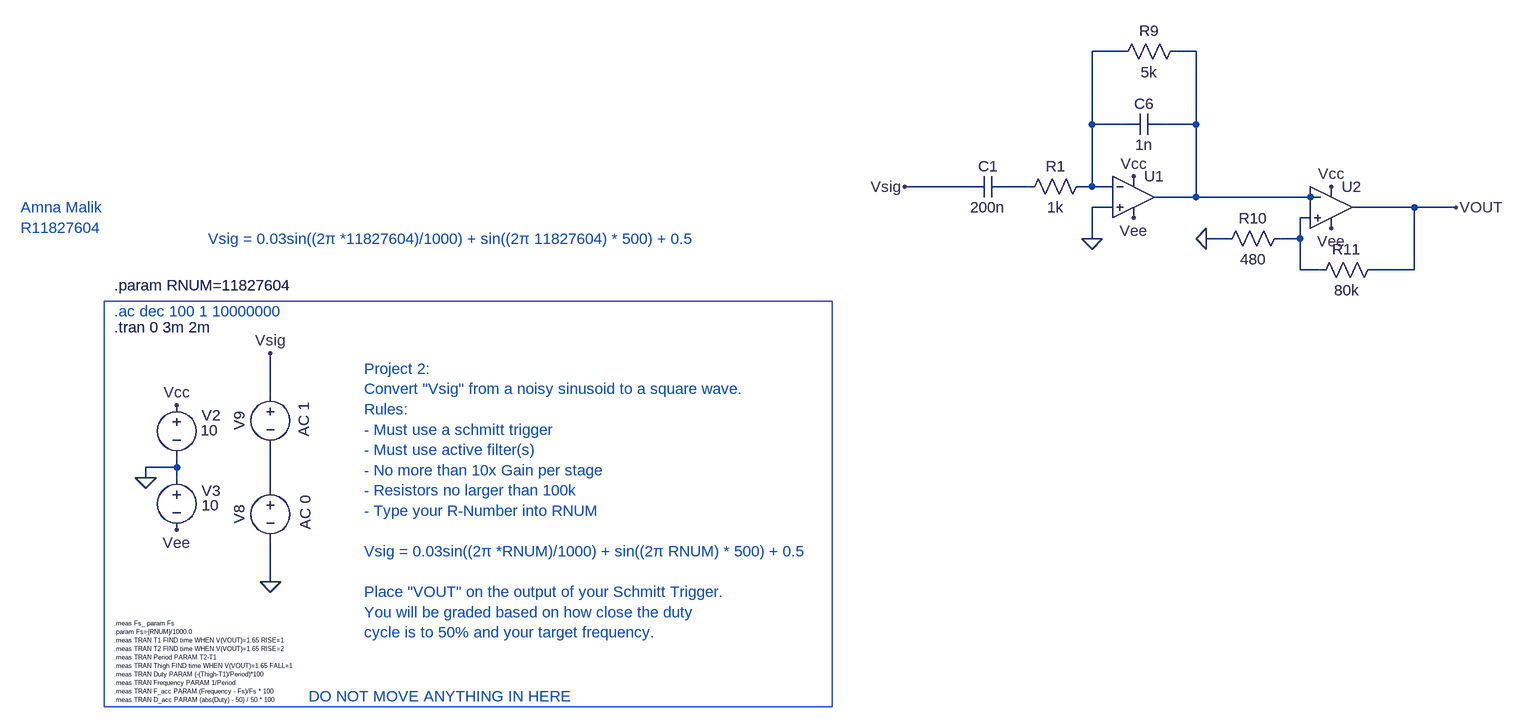
[diagram p0: schematic Project 2.asc]
Project 2.asc, the LTspice schematic file:
Version 4.1
SHEET 1 2724 1272
WIRE 1104 -432 1056 -432
WIRE 1216 -432 1184 -432
WIRE 1056 -320 1056 -432
WIRE 1104 -320 1056 -320
WIRE 1216 -320 1216 -432
WIRE 1216 -320 1168 -320
WIRE 864 -224 768 -224
WIRE 960 -224 928 -224
WIRE 1056 -224 1056 -320
WIRE 1056 -224 1040 -224
WIRE 1088 -224 1056 -224
WIRE 1216 -208 1216 -320
WIRE 1216 -208 1152 -208
WIRE 1392 -208 1216 -208
WIRE 1408 -208 1392 -208
WIRE 1088 -192 1056 -192
WIRE 1552 -192 1456 -192
WIRE 1616 -192 1552 -192
WIRE 1392 -176 1376 -176
WIRE 1056 -144 1056 -192
WIRE 1264 -144 1232 -144
WIRE 1376 -144 1376 -176
WIRE 1376 -144 1344 -144
WIRE 1376 -96 1376 -144
WIRE 1408 -96 1376 -96
WIRE 1552 -96 1552 -192
WIRE 1552 -96 1488 -96
WIRE -208 96 -208 32
WIRE -352 208 -352 192
WIRE -352 208 -400 208
WIRE -400 224 -400 208
WIRE -352 224 -352 208
WIRE -208 240 -208 176
WIRE -208 384 -208 320
FLAG -400 224 0
FLAG -352 112 Vcc
FLAG -352 304 Vee
FLAG 1616 -192 VOUT
FLAG -208 384 0
FLAG -208 32 Vsig
FLAG 1056 -144 0
FLAG 1232 -144 0
FLAG 768 -224 Vsig
FLAG 1120 -240 Vcc
FLAG 1424 -224 Vcc
FLAG 1120 -176 Vee
FLAG 1424 -160 Vee
SYMBOL voltage -352 96 R0
WINDOW 3 37 55 Left 2
WINDOW 123 0 0 Left 0
WINDOW 39 0 0 Left 0
WINDOW 0 38 32 Left 2
SYMATTR Value 10
SYMATTR InstName V2
SYMBOL voltage -352 208 R0
WINDOW 3 38 58 Left 2
WINDOW 123 0 0 Left 0
WINDOW 39 0 0 Left 0
WINDOW 0 38 36 Left 2
SYMATTR Value 10
SYMATTR InstName V3
SYMBOL voltage -208 224 R0
WINDOW 0 -32 56 VBottom 2
WINDOW 3 1 79 Invisible 2
WINDOW 123 38 53 VTop 2
WINDOW 39 0 0 Left 0
SYMATTR InstName V8
SYMATTR Value SINE(0 0.03 {Fs})
SYMATTR Value2 AC 0
SYMBOL voltage -208 80 R0
WINDOW 0 -32 56 VBottom 2
WINDOW 3 0 81 Invisible 2
WINDOW 123 36 54 VTop 2
WINDOW 39 0 0 Left 0
SYMATTR InstName V9
SYMATTR Value SINE(0.5 1 {Fs*500})
SYMATTR Value2 AC 1
SYMBOL res 1200 -448 R90
WINDOW 0 0 56 VBottom 2
WINDOW 3 32 56 VTop 2
SYMATTR InstName R9
SYMATTR Value 5k
SYMBOL cap 1168 -336 R90
WINDOW 0 0 32 VBottom 2
WINDOW 3 32 32 VTop 2
SYMATTR InstName C6
SYMATTR Value 1n
SYMBOL res 1360 -160 R90
WINDOW 0 0 56 VBottom 2
WINDOW 3 32 56 VTop 2
SYMATTR InstName R10
SYMATTR Value 480
SYMBOL res 1504 -112 R90
WINDOW 0 0 56 VBottom 2
WINDOW 3 32 56 VTop 2
SYMATTR InstName R11
SYMATTR Value 80k
SYMBOL cap 928 -240 R90
WINDOW 0 0 32 VBottom 2
WINDOW 3 32 32 VTop 2
SYMATTR InstName C1
SYMATTR Value 200n
SYMBOL res 1056 -240 R90
WINDOW 0 0 56 VBottom 2
WINDOW 3 32 56 VTop 2
SYMATTR InstName R1
SYMATTR Value 1k
SYMBOL OpAmps\\UniversalOpAmp2 1120 -208 R0
SYMATTR InstName U1
SYMBOL OpAmps\\UniversalOpAmp2 1424 -192 R0
SYMATTR InstName U2
TEXT -448 -32 Left 2 ;.ac dec 100 1 10000000
TEXT -448 -8 Left 2 !.tran 0 3m 2m
TEXT -448 -72 Left 2 !.param RNUM=11827604
TEXT -448 448 Left 0 !.meas Fs_ param Fs\n.param Fs={RNUM}/1000.0\n.meas TRAN T1 FIND time WHEN V(VOUT)=1.65 RISE=1\n.meas TRAN T2 FIND time WHEN V(VOUT)=1.65 RISE=2\n.meas TRAN Period PARAM T2-T1\n.meas TRAN Thigh FIND time WHEN V(VOUT)=1.65 FALL=1                  \n.meas TRAN Duty PARAM (-(Thigh-T1)/Period)*100\n.meas TRAN Frequency PARAM 1/Period\n.meas TRAN F_acc PARAM (Frequency - Fs)/Fs * 100\n.meas TRAN D_acc PARAM (abs(Duty) - 50) / 50 * 100
TEXT 256 560 Right 2 ;DO NOT MOVE ANYTHING IN HERE
TEXT -64 56 Left 2 ;Project 2:\nConvert "Vsig" from a noisy sinusoid to a square wave.\nRules:\n- Must use a schmitt trigger\n- Must use active filter(s)\n- No more than 10x Gain per stage\n- Resistors no larger than 100k\n- Type your R-Number into RNUM\n \nVsig = 0.03sin((2π *RNUM)/1000) + sin((2π RNUM) * 500) + 0.5\n \nPlace "VOUT" on the output of your Schmitt Trigger.\nYou will be graded based on how close the duty\ncycle is to 50% and your target frequency.
TEXT -304 -144 Left 2 ;Vsig = 0.03sin((2π *11827604)/1000) + sin((2π 11827604) * 500) + 0.5
TEXT -592 -192 Left 2 ;Amna Malik\nR11827604
RECTANGLE Normal 656 576 -464 -48

The netlist it stands for:
* Project 2.asc
V2 Vcc 0 10
V3 0 Vee 10
V8 N005 0 SINE(0 0.03 {Fs}) AC 0
V9 Vsig N005 SINE(0.5 1 {Fs*500}) AC 1
R9 N002 N001 5k
C6 N002 N001 1n
R10 N004 0 480
R11 VOUT N004 80k
C1 N003 Vsig 200n
R1 N001 N003 1k
X§U1 0 N001 Vcc Vee N002 level2 Avol=1Meg GBW=10Meg Slew=10Meg Ilimit=25m Rail=0 Vos=0 En=0 Enk=0 In=0 Ink=0 Rin=500Meg  ; pins In+ In- V+ V- OUT
X§U2 N004 N002 Vcc Vee VOUT level2 Avol=1Meg GBW=10Meg Slew=10Meg Ilimit=25m Rail=0 Vos=0 En=0 Enk=0 In=0 Ink=0 Rin=500Meg  ; pins In+ In- V+ V- OUT
* .ac dec 100 1 10000000
.tran 0 3m 2m
.param RNUM=11827604
.meas Fs_ param Fs
.param Fs={RNUM}/1000.0
.meas TRAN T1 FIND time WHEN V(VOUT)=1.65 RISE=1
.meas TRAN T2 FIND time WHEN V(VOUT)=1.65 RISE=2
.meas TRAN Period PARAM T2-T1
.meas TRAN Thigh FIND time WHEN V(VOUT)=1.65 FALL=1
.meas TRAN Duty PARAM (-(Thigh-T1)/Period)*100
.meas TRAN Frequency PARAM 1/Period
.meas TRAN F_acc PARAM (Frequency - Fs)/Fs * 100
.meas TRAN D_acc PARAM (abs(Duty) - 50) / 50 * 100
* DO NOT MOVE ANYTHING IN HERE
* Project 2:
* Convert "Vsig" from a noisy sinusoid to a square wave.
* Rules:
* - Must use a schmitt trigger
* - Must use active filter(s)
* - No more than 10x Gain per stage
* - Resistors no larger than 100k
* - Type your R-Number into RNUM
* Vsig = 0.03sin((2π *RNUM)/1000) + sin((2π RNUM) * 500) + 0.5
* Place "VOUT" on the output of your Schmitt Trigger.
* You will be graded based on how close the duty
* cycle is to 50% and your target frequency.
* Vsig = 0.03sin((2π *11827604)/1000) + sin((2π 11827604) * 500) + 0.5
* Amna Malik
* R11827604
.lib UniversalOpAmp2.lib
.backanno
.end

* Results of the author's LTspice run, read from the files saved beside the schematic
* Operating Point, zero values left out:
*   V(vcc) = 10 V
*   V(vee) = -10 V
*   V(vsig) = 500 mV
*   I(V2) = -1.999 mA
*   I(V3) = -1.999 mA
*   Ix(u1:3) = 999.5 µA
*   Ix(u1:4) = -999.5 µA
*   Ix(u2:3) = 999.5 µA
*   Ix(u2:4) = -999.5 µA
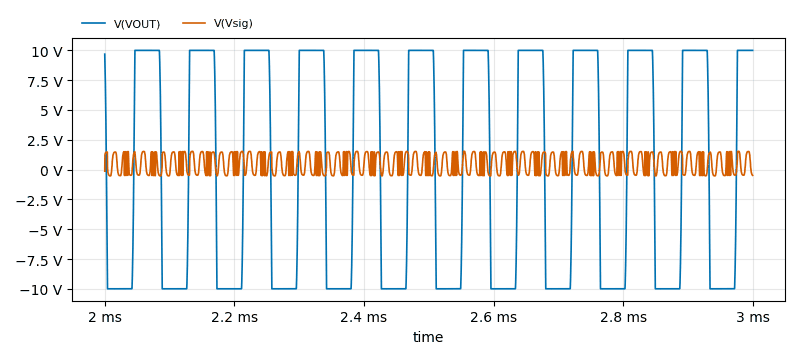
[diagram p1: Transient Analysis of Project 2.asc, plotted from the saved traces]
* Transient Analysis, 1 run:
*   V(VOUT): min -9.999 V, max 9.999 V, average -145.6 mV, rms 9.687 V, last 9.999 V
*   V(Vsig): min -530 mV, max 1.53 V, average 500.2 mV, rms 875.8 mV, last 1.06 V